# Altium schematic sheet machbiendoilenhdon.SchDoc
size 1071 x 817 mm
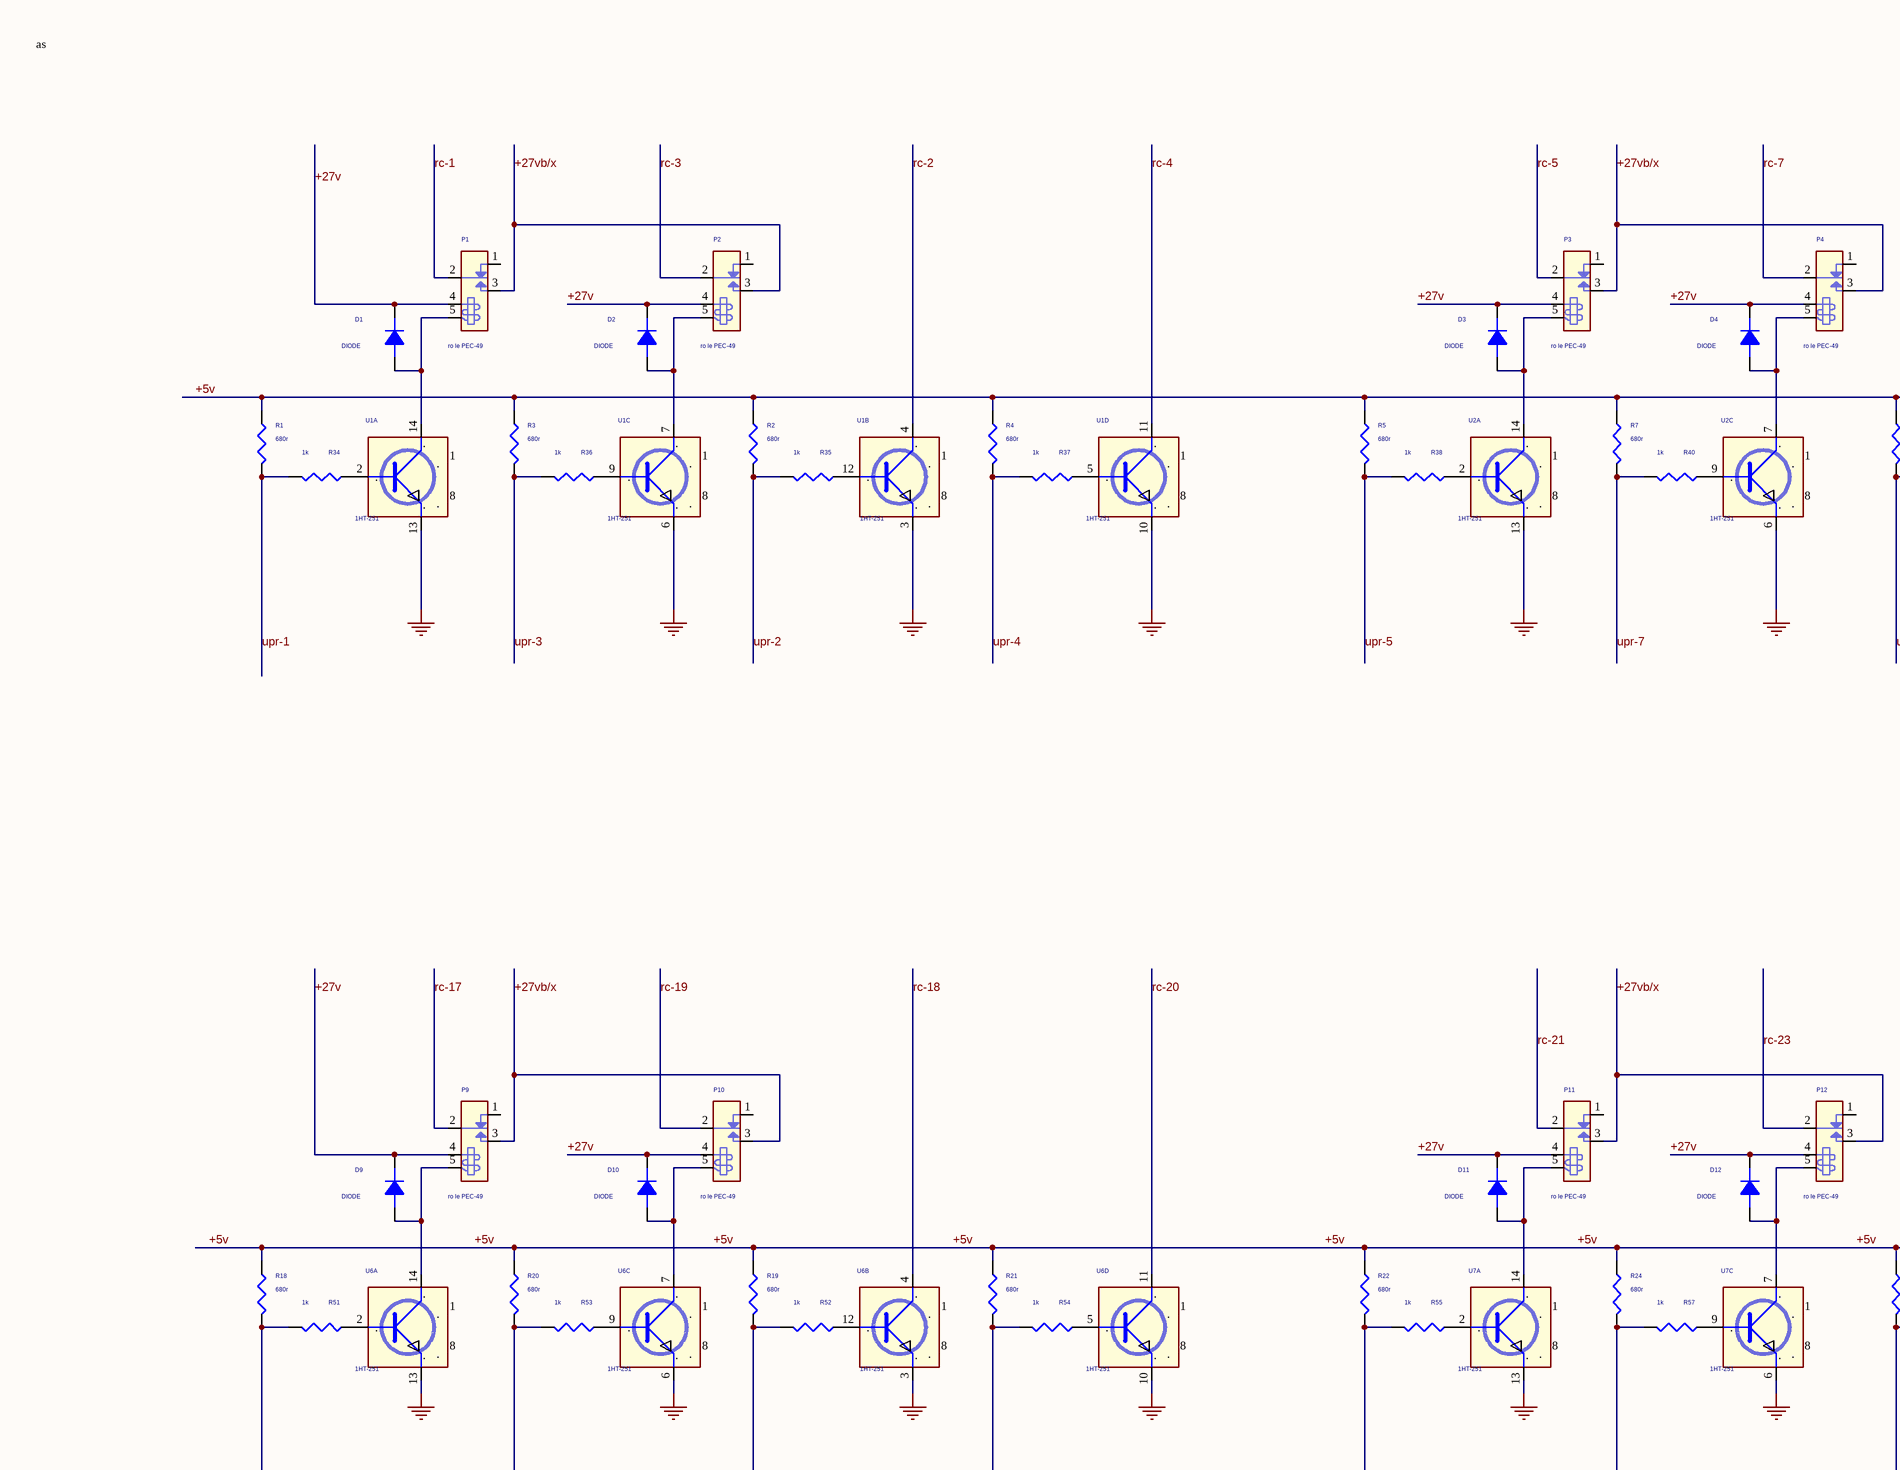
[diagram p0: machbiendoilenhdon.SchDoc, top left]
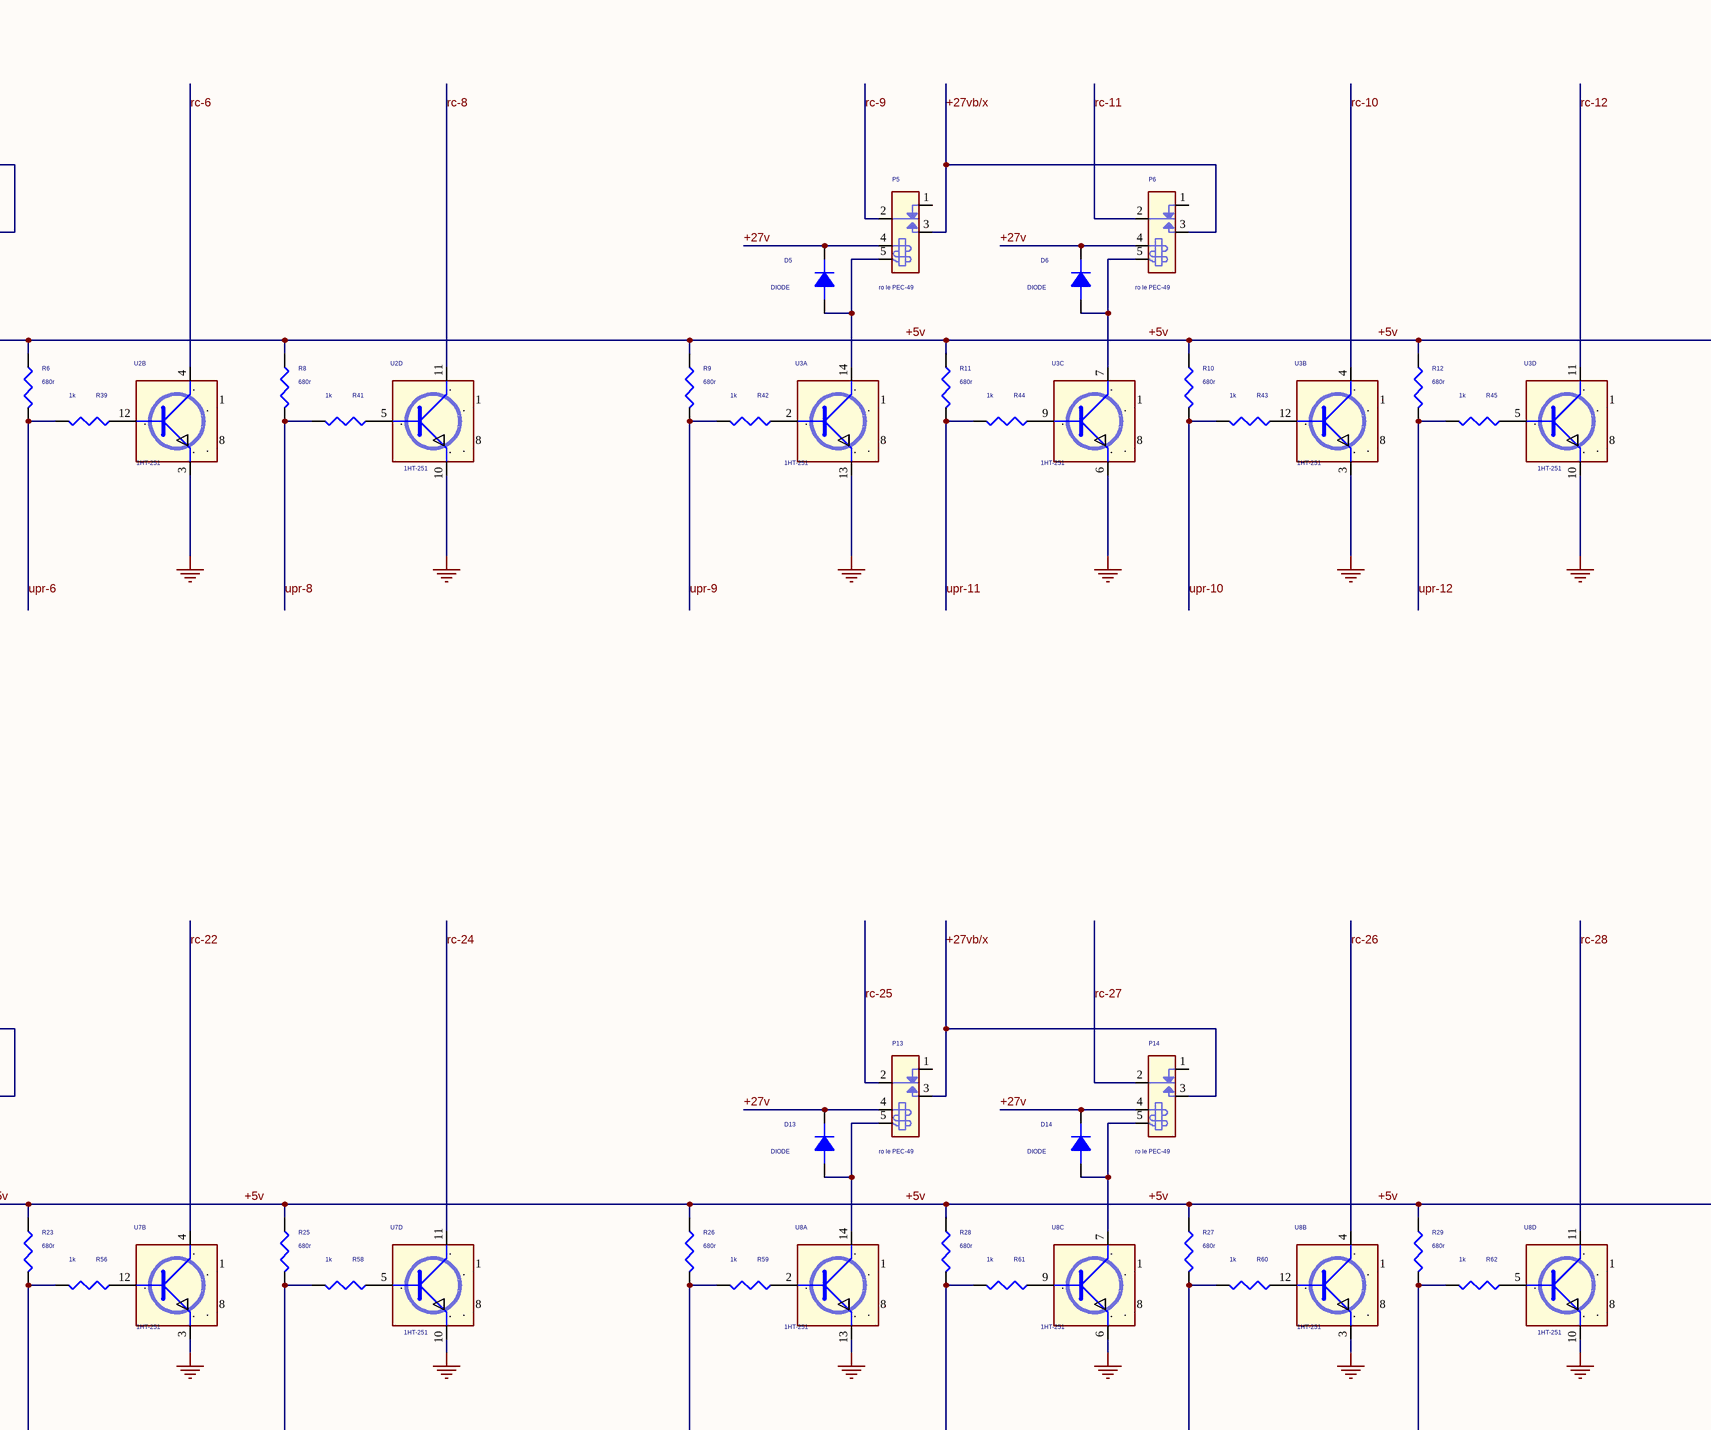
[diagram p1: machbiendoilenhdon.SchDoc, top middle]
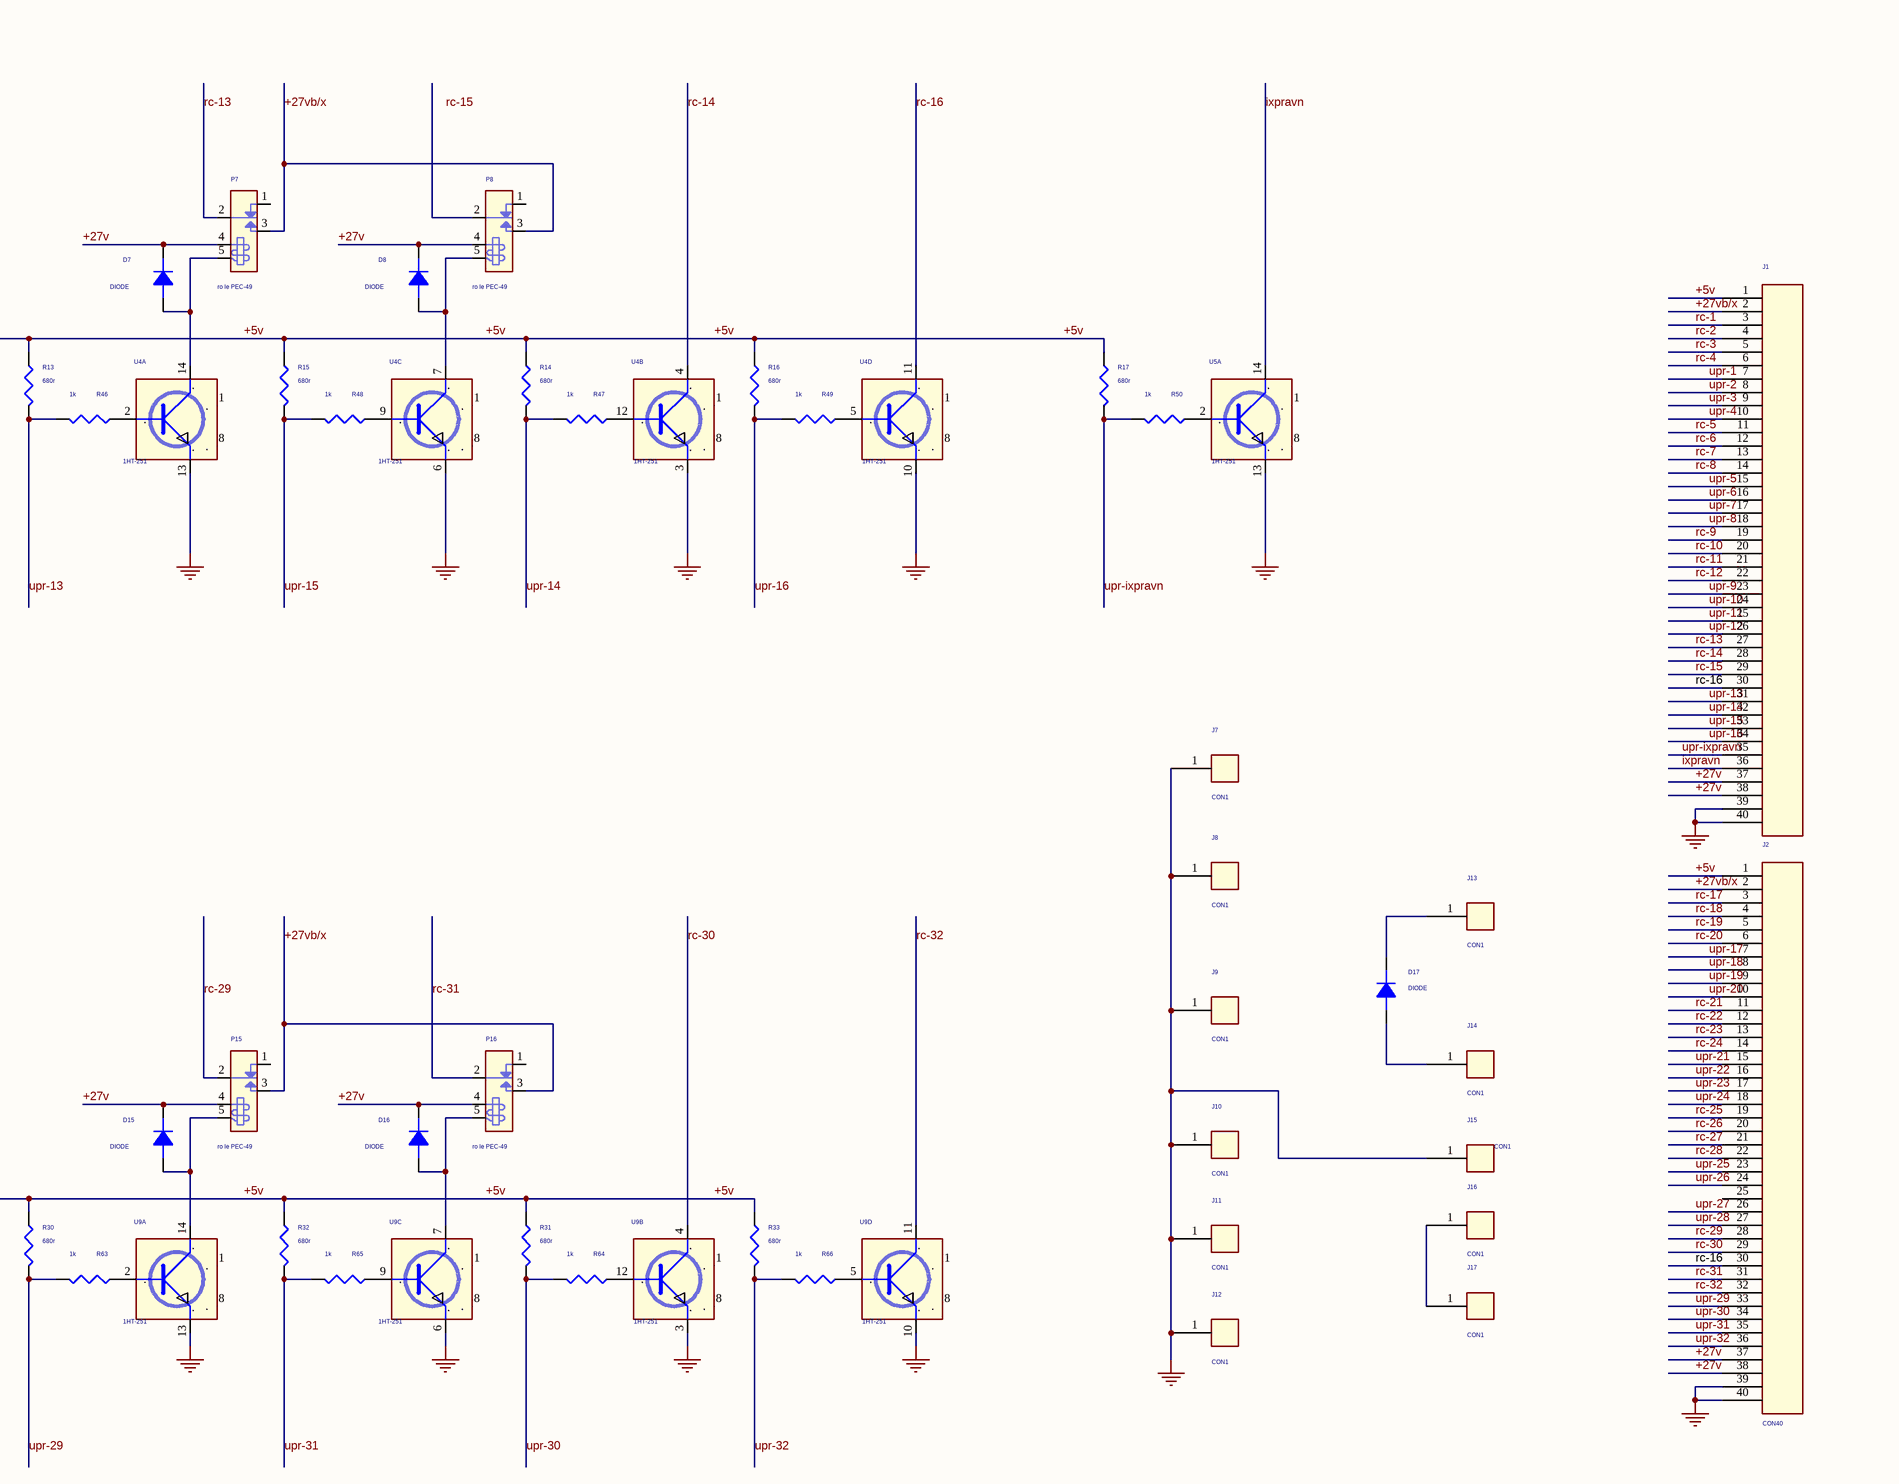
[diagram p2: machbiendoilenhdon.SchDoc, top right]
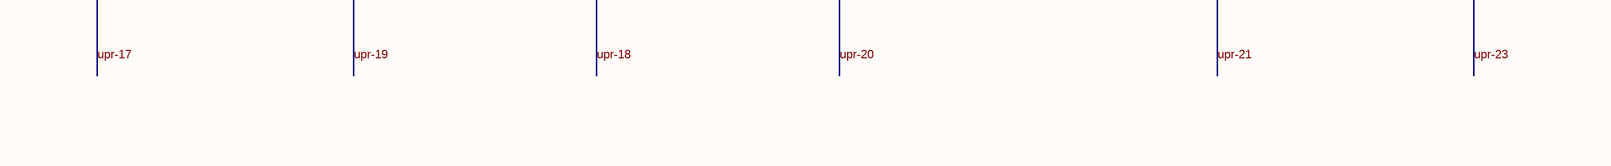
[diagram p3: machbiendoilenhdon.SchDoc, centre left]
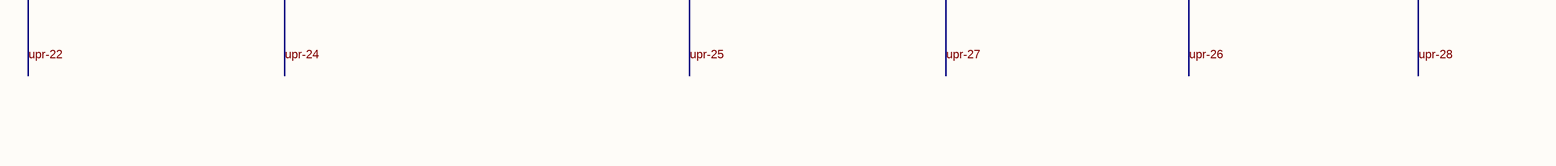
[diagram p4: machbiendoilenhdon.SchDoc, centre middle]
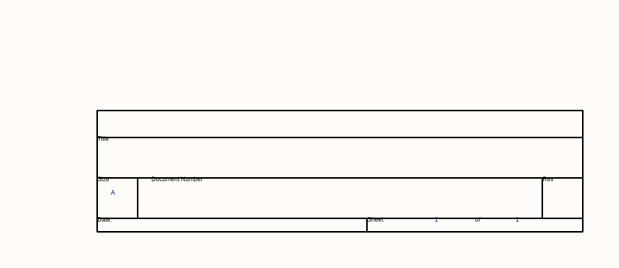
[diagram p5: machbiendoilenhdon.SchDoc, bottom right]

## Parts
(Parts that share a designator on the sheet are numbered #1, #2 ... from top to bottom, then left to right.)
*  Page Count: 1  Page Size: A  (hidden comment: TitleBlock0)  (graphical)
D1  DIODE  [DIOT _REV1]
D2  DIODE  [DIOT _REV1]
D3  DIODE  [DIOT _REV1]
D4  DIODE  [DIOT _REV1]
D5  DIODE  [DIOT _REV1]
D6  DIODE  [DIOT _REV1]
D7  DIODE  [DIOT _REV1]
D8  DIODE  [DIOT _REV1]
D9  DIODE  [DIOT _REV1]
D10  DIODE  [DIOT _REV1]
D11  DIODE  [DIOT _REV1]
D12  DIODE  [DIOT _REV1]
D13  DIODE  [DIOT _REV1]
D14  DIODE  [DIOT _REV1]
D15  DIODE  [DIOT _REV1]
D16  DIODE  [DIOT _REV1]
D17  DIODE  [DIOT _REV1]
J1  CON40  [con40]  (value not drawn)
J2  CON40  [con40]
J7  CON1  [CON1]
J8  CON1  [CON1]
J9  CON1  [CON1]
J10  CON1  [CON1]
J11  CON1  [CON1]
J12  CON1  [CON1]
J13  CON1  [CON1]
J14  CON1  [CON1]
J15  CON1  [CON1]
J16  CON1  [CON1]
J17  CON1  [CON1]
P1  ro le PEC-49  [ROLE A313/3_REV4]
P2  ro le PEC-49  [ROLE A313/3_REV4]
P3  ro le PEC-49  [ROLE A313/3_REV4]
P4  ro le PEC-49  [ROLE A313/3_REV4]
P5  ro le PEC-49  [ROLE A313/3_REV4]
P6  ro le PEC-49  [ROLE A313/3_REV4]
P7  ro le PEC-49  [ROLE A313/3_REV4]
P8  ro le PEC-49  [ROLE A313/3_REV4]
P9  ro le PEC-49  [ROLE A313/3_REV4]
P10  ro le PEC-49  [ROLE A313/3_REV4]
P11  ro le PEC-49  [ROLE A313/3_REV4]
P12  ro le PEC-49  [ROLE A313/3_REV4]
P13  ro le PEC-49  [ROLE A313/3_REV4]
P14  ro le PEC-49  [ROLE A313/3_REV4]
P15  ro le PEC-49  [ROLE A313/3_REV4]
P16  ro le PEC-49  [ROLE A313/3_REV4]
R1  680r  [0805]
R2  680r  [0805]
R3  680r  [0805]
R4  680r  [0805]
R5  680r  [0805]
R6  680r  [0805]
R7  680r  [0805]
R8  680r  [0805]
R9  680r  [0805]
R10  680r  [0805]
R11  680r  [0805]
R12  680r  [0805]
R13  680r  [0805]
R14  680r  [0805]
R15  680r  [0805]
R16  680r  [0805]
R17  680r  [0805]
R18  680r  [0805]
R19  680r  [0805]
R20  680r  [0805]
R21  680r  [0805]
R22  680r  [0805]
R23  680r  [0805]
R24  680r  [0805]
R25  680r  [0805]
R26  680r  [0805]
R27  680r  [0805]
R28  680r  [0805]
R29  680r  [0805]
R30  680r  [0805]
R31  680r  [0805]
R32  680r  [0805]
R33  680r  [0805]
R34  1k  [0805]
R35  1k  [0805]
R36  1k  [0805]
R37  1k  [0805]
R38  1k  [0805]
R39  1k  [0805]
R40  1k  [0805]
R41  1k  [0805]
R42  1k  [0805]
R43  1k  [0805]
R44  1k  [0805]
R45  1k  [0805]
R46  1k  [0805]
R47  1k  [0805]
R48  1k  [0805]
R49  1k  [0805]
R50  1k  [0805]
R51  1k  [0805]
R52  1k  [0805]
R53  1k  [0805]
R54  1k  [0805]
R55  1k  [0805]
R56  1k  [0805]
R57  1k  [0805]
R58  1k  [0805]
R59  1k  [0805]
R60  1k  [0805]
R61  1k  [0805]
R62  1k  [0805]
R63  1k  [0805]
R64  1k  [0805]
R65  1k  [0805]
R66  1k  [0805]
U1#1  1HT-251  [1HT-251]  (part A of 4)
U1#2  1HT-251  [1HT-251]  (part C of 4)
U1#3  1HT-251  [1HT-251]  (part B of 4)
U1#4  1HT-251  [1HT-251]  (part D of 4)
U2#1  1HT-251  [1HT-251]  (part A of 4)
U2#2  1HT-251  [1HT-251]  (part C of 4)
U2#3  1HT-251  [1HT-251]  (part B of 4)
U2#4  1HT-251  [1HT-251]  (part D of 4)
U3#1  1HT-251  [1HT-251]  (part A of 4)
U3#2  1HT-251  [1HT-251]  (part C of 4)
U3#3  1HT-251  [1HT-251]  (part B of 4)
U3#4  1HT-251  [1HT-251]  (part D of 4)
U4#1  1HT-251  [1HT-251]  (part A of 4)
U4#2  1HT-251  [1HT-251]  (part C of 4)
U4#3  1HT-251  [1HT-251]  (part B of 4)
U4#4  1HT-251  [1HT-251]  (part D of 4)
U5  1HT-251  [1HT-251]  (part A of 4)
U6#1  1HT-251  [1HT-251]  (part A of 4)
U6#2  1HT-251  [1HT-251]  (part C of 4)
U6#3  1HT-251  [1HT-251]  (part B of 4)
U6#4  1HT-251  [1HT-251]  (part D of 4)
U7#1  1HT-251  [1HT-251]  (part A of 4)
U7#2  1HT-251  [1HT-251]  (part C of 4)
U7#3  1HT-251  [1HT-251]  (part B of 4)
U7#4  1HT-251  [1HT-251]  (part D of 4)
U8#1  1HT-251  [1HT-251]  (part A of 4)
U8#2  1HT-251  [1HT-251]  (part C of 4)
U8#3  1HT-251  [1HT-251]  (part B of 4)
U8#4  1HT-251  [1HT-251]  (part D of 4)
U9#1  1HT-251  [1HT-251]  (part A of 4)
U9#2  1HT-251  [1HT-251]  (part C of 4)
U9#3  1HT-251  [1HT-251]  (part B of 4)
U9#4  1HT-251  [1HT-251]  (part D of 4)

## Nets
GND: J1.39 J1.40 J2.39 J2.40 J7.1 J8.1 J9.1 J10.1 J11.1 J12.1 J15.1 U1#1.13(.) U1#2.6(.) U1#3.3(.) U1#4.10(.) U2#1.13(.) U2#2.6(.) U2#3.3(.) U2#4.10(.) U3#1.13(.) U3#2.6(.) U3#3.3(.) U3#4.10(.) U4#1.13(.) U4#2.6(.) U4#3.3(.) U4#4.10(.) U5.13(.) U6#1.13(.) U6#2.6(.) U6#3.3(.) U6#4.10(.) U7#1.13(.) U7#2.6(.) U7#3.3(.) U7#4.10(.) U8#1.13(.) U8#2.6(.) U8#3.3(.) U8#4.10(.) U9#1.13(.) U9#2.6(.) U9#3.3(.) U9#4.10(.)
+5v: J1.1 J2.1 R1.1 R2.1 R3.1 R4.1 R5.1 R6.1 R7.1 R8.1 R9.1 R10.1 R11.1 R12.1 R13.1 R14.1 R15.1 R16.1 R17.1 R18.1 R19.1 R20.1 R21.1 R22.1 R23.1 R24.1 R25.1 R26.1 R27.1 R28.1 R29.1 R30.1 R31.1 R32.1 R33.1
+27v: D1.2(K) D2.2(K) D3.2(K) D4.2(K) D5.2(K) D6.2(K) D7.2(K) D8.2(K) D9.2(K) D10.2(K) D11.2(K) D12.2(K) D13.2(K) D14.2(K) D15.2(K) D16.2(K) J1.37 J1.38 J2.37 J2.38 P1.4(COIL1) P2.4(COIL1) P3.4(COIL1) P4.4(COIL1) P5.4(COIL1) P6.4(COIL1) P7.4(COIL1) P8.4(COIL1) P9.4(COIL1) P10.4(COIL1) P11.4(COIL1) P12.4(COIL1) P13.4(COIL1) P14.4(COIL1) P15.4(COIL1) P16.4(COIL1)
+27vb/x: J1.2 J2.2 P1.3(NO) P2.3(NO) P3.3(NO) P4.3(NO) P5.3(NO) P6.3(NO) P7.3(NO) P8.3(NO) P9.3(NO) P10.3(NO) P11.3(NO) P12.3(NO) P13.3(NO) P14.3(NO) P15.3(NO) P16.3(NO)
ixpravn: J1.36 U5.14(.)
rc-1: J1.3 P1.2(COMMON)
rc-2: J1.4 U1#3.4(.)
rc-3: J1.5 P2.2(COMMON)
rc-4: J1.6 U1#4.11(.)
rc-5: J1.11 P3.2(COMMON)
rc-6: J1.12 U2#3.4(.)
rc-7: J1.13 P4.2(COMMON)
rc-8: J1.14 U2#4.11(.)
rc-9: J1.19 P5.2(COMMON)
rc-10: J1.20 U3#3.4(.)
rc-11: J1.21 P6.2(COMMON)
rc-12: J1.22 U3#4.11(.)
rc-13: J1.27 P7.2(COMMON)
rc-14: J1.28 U4#3.4(.)
rc-15: J1.29
rc-16: J1.30 J2.30 U4#4.11(.)
rc-17: J2.3 P9.2(COMMON)
rc-18: J2.4 U6#3.4(.)
rc-19: J2.5 P10.2(COMMON)
rc-20: J2.6 U6#4.11(.)
rc-21: J2.11 P11.2(COMMON)
rc-22: J2.12 U7#3.4(.)
rc-23: J2.13 P12.2(COMMON)
rc-24: J2.14 U7#4.11(.)
rc-25: J2.19 P13.2(COMMON)
rc-26: J2.20 U8#3.4(.)
rc-27: J2.21 P14.2(COMMON)
rc-28: J2.22 U8#4.11(.)
rc-29: J2.28 P15.2(COMMON)
rc-30: J2.29 U9#3.4(.)
rc-31: J2.31 P16.2(COMMON)
rc-32: J2.32 U9#4.11(.)
upr-1: J1.7 R1.2 R34.2
upr-2: J1.8 R2.2 R35.2
upr-3: J1.9 R3.2 R36.2
upr-4: J1.10 R4.2 R37.2
upr-5: J1.15 R5.2 R38.2
upr-6: J1.16 R6.2 R39.2
upr-7: J1.17 R7.2 R40.2
upr-8: J1.18 R8.2 R41.2
upr-9: J1.23 R9.2 R42.2
upr-10: J1.24 R10.2 R43.2
upr-11: J1.25 R11.2 R44.2
upr-12: J1.26 R12.2 R45.2
upr-13: J1.31 R13.2 R46.2
upr-14: J1.32 R14.2 R47.2
upr-15: J1.33 R15.2 R48.2
upr-16: J1.34 R16.2 R49.2
upr-17: J2.7 R18.2 R51.2
upr-18: J2.8 R19.2 R52.2
upr-19: J2.9 R20.2 R53.2
upr-20: J2.10 R21.2 R54.2
upr-21: J2.15 R22.2 R55.2
upr-22: J2.16 R23.2 R56.2
upr-23: J2.17 R24.2 R57.2
upr-24: J2.18 R25.2 R58.2
upr-25: J2.23 R26.2 R59.2
upr-26: J2.24 R27.2 R60.2
upr-27: J2.26 R28.2 R61.2
upr-28: J2.27 R29.2 R62.2
upr-29: J2.33 R30.2 R63.2
upr-30: J2.34 R31.2 R64.2
upr-31: J2.35 R32.2 R65.2
upr-32: J2.36 R33.2 R66.2
upr-ixpravn: J1.35 R17.2 R50.2
NetD1_1: D1.1(A) P1.5(COIL2) U1#1.14(.)
NetD2_1: D2.1(A) P2.5(COIL2) U1#2.7(.)
NetD3_1: D3.1(A) P3.5(COIL2) U2#1.14(.)
NetD4_1: D4.1(A) P4.5(COIL2) U2#2.7(.)
NetD5_1: D5.1(A) P5.5(COIL2) U3#1.14(.)
NetD6_1: D6.1(A) P6.5(COIL2) U3#2.7(.)
NetD7_1: D7.1(A) P7.5(COIL2) U4#1.14(.)
NetD8_1: D8.1(A) P8.5(COIL2) U4#2.7(.)
NetD9_1: D9.1(A) P9.5(COIL2) U6#1.14(.)
NetD10_1: D10.1(A) P10.5(COIL2) U6#2.7(.)
NetD11_1: D11.1(A) P11.5(COIL2) U7#1.14(.)
NetD12_1: D12.1(A) P12.5(COIL2) U7#2.7(.)
NetD13_1: D13.1(A) P13.5(COIL2) U8#1.14(.)
NetD14_1: D14.1(A) P14.5(COIL2) U8#2.7(.)
NetD15_1: D15.1(A) P15.5(COIL2) U9#1.14(.)
NetD16_1: D16.1(A) P16.5(COIL2) U9#2.7(.)
NetD17_1: D17.1(A) J14.1
NetD17_2: D17.2(K) J13.1
NetJ16_1: J16.1 J17.1
NetR34_1: R34.1 U1#1.2(.)
NetR35_1: R35.1 U1#3.12(.)
NetR36_1: R36.1 U1#2.9(.)
NetR37_1: R37.1 U1#4.5(.)
NetR38_1: R38.1 U2#1.2(.)
NetR39_1: R39.1 U2#3.12(.)
NetR40_1: R40.1 U2#2.9(.)
NetR41_1: R41.1 U2#4.5(.)
NetR42_1: R42.1 U3#1.2(.)
NetR43_1: R43.1 U3#3.12(.)
NetR44_1: R44.1 U3#2.9(.)
NetR45_1: R45.1 U3#4.5(.)
NetR46_1: R46.1 U4#1.2(.)
NetR47_1: R47.1 U4#3.12(.)
NetR48_1: R48.1 U4#2.9(.)
NetR49_1: R49.1 U4#4.5(.)
NetR50_1: R50.1 U5.2(.)
NetR51_1: R51.1 U6#1.2(.)
NetR52_1: R52.1 U6#3.12(.)
NetR53_1: R53.1 U6#2.9(.)
NetR54_1: R54.1 U6#4.5(.)
NetR55_1: R55.1 U7#1.2(.)
NetR56_1: R56.1 U7#3.12(.)
NetR57_1: R57.1 U7#2.9(.)
NetR58_1: R58.1 U7#4.5(.)
NetR59_1: R59.1 U8#1.2(.)
NetR60_1: R60.1 U8#3.12(.)
NetR61_1: R61.1 U8#2.9(.)
NetR62_1: R62.1 U8#4.5(.)
NetR63_1: R63.1 U9#1.2(.)
NetR64_1: R64.1 U9#3.12(.)
NetR65_1: R65.1 U9#2.9(.)
NetR66_1: R66.1 U9#4.5(.)

Not connected (* = marked no-connect by the designer): J2 25; P1 1(NC); P2 1(NC); P3 1(NC); P4 1(NC); P5 1(NC); P6 1(NC); P7 1(NC); P8 1(NC) 2(COMMON); P9 1(NC); P10 1(NC); P11 1(NC); P12 1(NC); P13 1(NC); P14 1(NC); P15 1(NC); P16 1(NC); U1#1 1(.) 8(.); U1#2 1(.) 8(.); U1#3 1(.) 8(.); U1#4 1(.) 8(.); U2#1 1(.) 8(.); U2#2 1(.) 8(.); U2#3 1(.) 8(.); U2#4 1(.) 8(.); U3#1 1(.) 8(.); U3#2 1(.) 8(.); U3#3 1(.) 8(.); U3#4 1(.) 8(.); U4#1 1(.) 8(.); U4#2 1(.) 8(.); U4#3 1(.) 8(.); U4#4 1(.) 8(.); U5 1(.) 8(.); U6#1 1(.) 8(.); U6#2 1(.) 8(.); U6#3 1(.) 8(.); U6#4 1(.) 8(.); U7#1 1(.) 8(.); U7#2 1(.) 8(.); U7#3 1(.) 8(.); U7#4 1(.) 8(.); U8#1 1(.) 8(.); U8#2 1(.) 8(.); U8#3 1(.) 8(.); U8#4 1(.) 8(.); U9#1 1(.) 8(.); U9#2 1(.) 8(.); U9#3 1(.) 8(.); U9#4 1(.) 8(.)

## Notes on the sheet
- as
- Labels drawn without touching a wire or pin: rc-15
- (in symbol TitleBlock0) Title; Size; Document Number; Rev; Date:; Sheet; of

## Library data of the parts
P1-P16 = RELAY_SPDT_0
R1-R66 = R
U1#1 U2#1 U3#1 U4#1 U6#1 U7#1 U8#1 U9#1 = 1HT-251_2
U1#2 U2#2 U3#2 U4#2 U6#2 U7#2 U8#2 U9#2 = 1HT-251_3
U1#3 U2#3 U3#3 U4#3 U6#3 U7#3 U8#3 U9#3 = 1HT-251_1
U1#4 U2#4 U3#4 U4#4 U5 U6#4 U7#4 U8#4 U9#4 = 1HT-251_4
* = TitleBlock0: Page Number: 1; Page Create Date: March  8, 1995